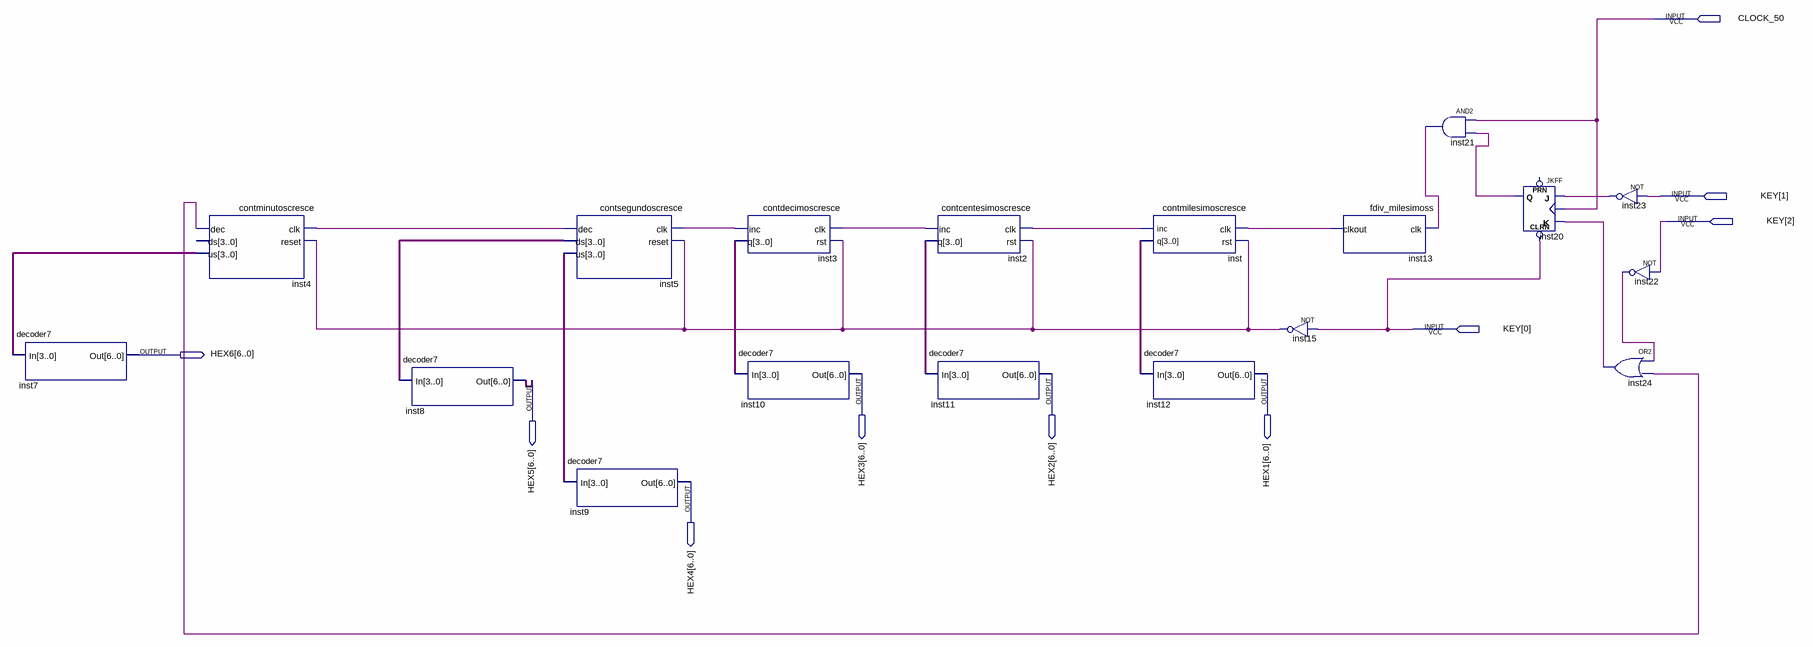
[diagram p0: schematic sheet]
// Quartus schematic fdiv_milesimos.bdf as structural Verilog: 18 symbols, 10 pins
module fdiv_milesimos (
  input  CLOCK_50,
  input  [2:0] KEY,
  output [6:0] HEX6,
  output [6:0] HEX3,
  output [6:0] HEX2,
  output [6:0] HEX1,
  output [6:0] HEX5,
  output [6:0] HEX4
);

  wire inst2_inc, inst3_inc, inst4_dec, inst5_dec, inst13_clkout, inst15_out, inst20_q, inst21_out,
       inst22_out, inst23_out, inst24_out, inst_inc;
  wire [3:0] inst2_q, inst3_q, inst4_us, inst5_ds, inst5_us, inst_q;

  decoder7 inst7 (.In(inst4_us), .Out(HEX6));
  contminutoscresce inst4 (.clk(inst5_dec), .reset(inst15_out), .dec(inst4_dec), .us(inst4_us));  // open: ds
  decoder7 inst8 (.In(inst5_ds), .Out(HEX5));
  contsegundoscresce inst5 (.clk(inst3_inc), .reset(inst15_out), .dec(inst5_dec), .ds(inst5_ds), .us(inst5_us));
  decoder7 inst9 (.In(inst5_us), .Out(HEX4));
  contdecimoscresce inst3 (.clk(inst2_inc), .rst(inst15_out), .inc(inst3_inc), .q(inst3_q));
  decoder7 inst10 (.In(inst3_q), .Out(HEX3));
  contcentesimoscresce inst2 (.clk(inst_inc), .rst(inst15_out), .inc(inst2_inc), .q(inst2_q));
  decoder7 inst11 (.In(inst2_q), .Out(HEX2));
  contmilesimoscresce inst (.clk(inst13_clkout), .rst(inst15_out), .inc(inst_inc), .q(inst_q));
  decoder7 inst12 (.In(inst_q), .Out(HEX1));
  not inst15 (inst15_out, KEY[0]);
  fdiv_milesimoss inst13 (.clk(inst21_out), .clkout(inst13_clkout));
  and inst21 (inst21_out, CLOCK_50, inst20_q);
  JKFF inst20 (.CLRN(KEY[0]), .K(inst24_out), .J(inst23_out), .CLK(CLOCK_50), .Q(inst20_q));  // open: PRN
  not inst23 (inst23_out, KEY[1]);
  or inst24 (inst24_out, inst22_out, inst4_dec);
  not inst22 (inst22_out, KEY[2]);
endmodule
